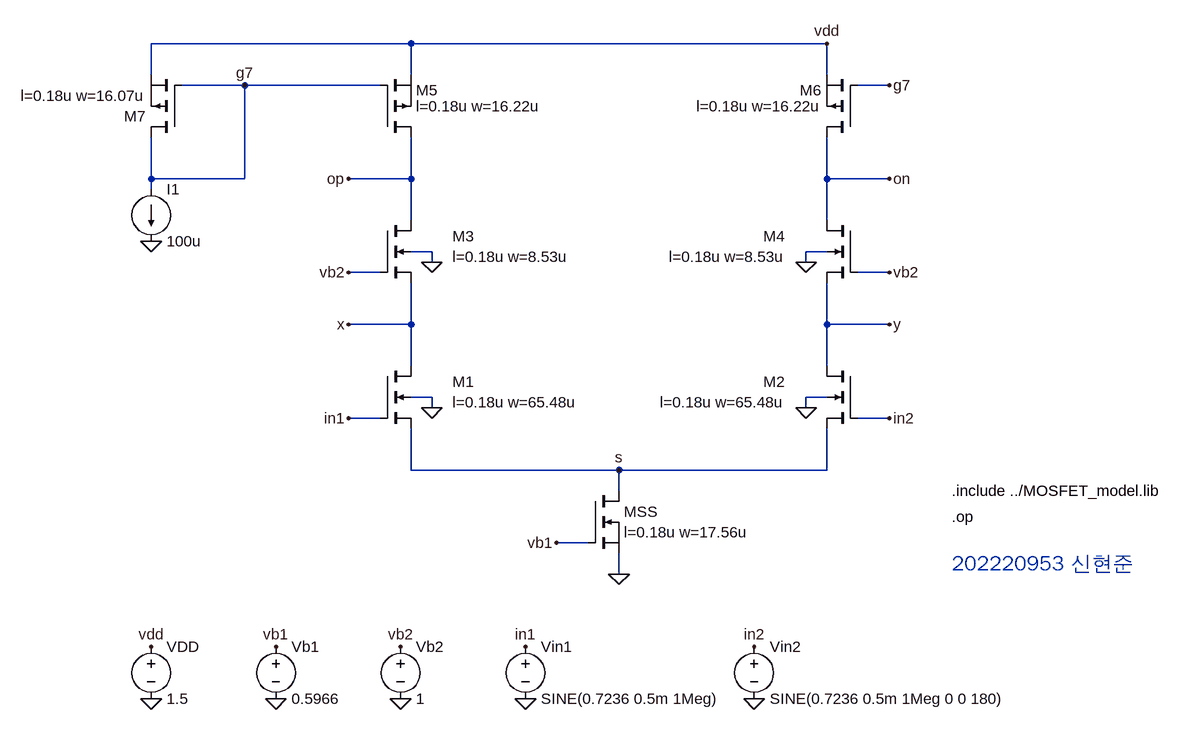
[diagram p0: schematic diffamp.asc]
diffamp.asc, the LTspice schematic file:
Version 4
SHEET 1 1800 1200
WIRE 160 96 560 96
WIRE 560 96 1200 96
FLAG 1200 96 vdd
WIRE 160 96 160 144
WIRE 560 96 560 144
WIRE 1200 96 1200 144
SYMBOL pmos 208 240 R180
WINDOW 3 0 0 Invisible 2
WINDOW 123 56 64 Left 2
SYMATTR InstName M7
SYMATTR Value CMOSP
SYMATTR Value2 l=0.18u w=16.07u
WIRE 160 240 160 304
WIRE 160 304 304 304
WIRE 304 304 304 160
WIRE 208 160 304 160
WIRE 304 160 512 160
FLAG 304 160 g7
DATAFLAG 408 208 "V(g7)"
DATAFLAG 40 272 "Id(M7)"
WIRE 160 304 160 320
SYMBOL current 160 320 R0
SYMATTR InstName I1
SYMATTR Value 100u
FLAG 160 400 0
SYMBOL pmos 512 240 M180
WINDOW 3 0 0 Invisible 2
WINDOW 0 56 72 Left 2
WINDOW 123 56 48 Left 2
SYMATTR InstName M5
SYMATTR Value CMOSP
SYMATTR Value2 l=0.18u w=16.22u
SYMBOL nmos4 512 368 R0
WINDOW 3 0 0 Invisible 2
WINDOW 0 112 24 Left 2
WINDOW 123 112 56 Left 2
SYMATTR InstName M3
SYMATTR Value CMOSN
SYMATTR Value2 l=0.18u w=8.53u
SYMBOL nmos4 512 592 R0
WINDOW 3 0 0 Invisible 2
WINDOW 0 112 24 Left 2
WINDOW 123 112 56 Left 2
SYMATTR InstName M1
SYMATTR Value CMOSN
SYMATTR Value2 l=0.18u w=65.48u
WIRE 560 240 560 304
WIRE 560 304 560 368
WIRE 560 304 464 304
FLAG 464 304 op
WIRE 560 464 560 528
WIRE 560 528 560 592
WIRE 560 528 464 528
FLAG 464 528 x
WIRE 512 448 464 448
FLAG 464 448 vb2
WIRE 512 672 464 672
FLAG 464 672 in1
WIRE 560 416 592 416
WIRE 592 416 592 432
FLAG 592 432 0
WIRE 560 640 592 640
WIRE 592 640 592 656
FLAG 592 656 0
DATAFLAG 680 304 "V(op)"
DATAFLAG 680 528 "V(x)"
DATAFLAG 680 256 "Id(M5)"
DATAFLAG 720 464 "Id(M3)"
DATAFLAG 720 688 "Id(M1)"
SYMBOL pmos 1248 240 R180
WINDOW 3 0 0 Invisible 2
WINDOW 0 56 72 Left 2
WINDOW 123 56 48 Left 2
SYMATTR InstName M6
SYMATTR Value CMOSP
SYMATTR Value2 l=0.18u w=16.22u
SYMBOL nmos4 1248 368 M0
WINDOW 3 0 0 Invisible 2
WINDOW 0 112 24 Left 2
WINDOW 123 112 56 Left 2
SYMATTR InstName M4
SYMATTR Value CMOSN
SYMATTR Value2 l=0.18u w=8.53u
SYMBOL nmos4 1248 592 M0
WINDOW 3 0 0 Invisible 2
WINDOW 0 112 24 Left 2
WINDOW 123 112 56 Left 2
SYMATTR InstName M2
SYMATTR Value CMOSN
SYMATTR Value2 l=0.18u w=65.48u
WIRE 1200 240 1200 304
WIRE 1200 304 1200 368
WIRE 1200 304 1296 304
FLAG 1296 304 on
WIRE 1200 464 1200 528
WIRE 1200 528 1200 592
WIRE 1200 528 1296 528
FLAG 1296 528 y
WIRE 1248 448 1296 448
FLAG 1296 448 vb2
WIRE 1248 672 1296 672
FLAG 1296 672 in2
WIRE 1248 160 1296 160
FLAG 1296 160 g7
WIRE 1200 416 1168 416
WIRE 1168 416 1168 432
FLAG 1168 432 0
WIRE 1200 640 1168 640
WIRE 1168 640 1168 656
FLAG 1168 656 0
DATAFLAG 1080 304 "V(on)"
DATAFLAG 1080 528 "V(y)"
DATAFLAG 1080 256 "Id(M6)"
DATAFLAG 1040 464 "Id(M4)"
DATAFLAG 1040 688 "Id(M2)"
WIRE 560 688 560 752
WIRE 1200 688 1200 752
WIRE 560 752 880 752
WIRE 880 752 1200 752
FLAG 880 752 s
DATAFLAG 720 784 "V(s)"
SYMBOL nmos 832 784 R0
WINDOW 3 0 0 Invisible 2
WINDOW 123 56 64 Left 2
SYMATTR InstName MSS
SYMATTR Value CMOSN
SYMATTR Value2 l=0.18u w=17.56u
WIRE 880 752 880 784
WIRE 880 880 880 912
FLAG 880 912 0
WIRE 832 864 784 864
FLAG 784 864 vb1
DATAFLAG 1008 912 "Id(MSS)"
SYMBOL voltage 160 1008 R0
WINDOW 0 24 16 Left 2
WINDOW 3 24 96 Left 2
SYMATTR InstName VDD
SYMATTR Value 1.5
FLAG 160 1024 vdd
FLAG 160 1104 0
SYMBOL voltage 352 1008 R0
WINDOW 0 24 16 Left 2
WINDOW 3 24 96 Left 2
SYMATTR InstName Vb1
SYMATTR Value 0.5966
FLAG 352 1024 vb1
FLAG 352 1104 0
SYMBOL voltage 544 1008 R0
WINDOW 0 24 16 Left 2
WINDOW 3 24 96 Left 2
SYMATTR InstName Vb2
SYMATTR Value 1
FLAG 544 1024 vb2
FLAG 544 1104 0
SYMBOL voltage 736 1008 R0
WINDOW 0 24 16 Left 2
WINDOW 3 24 96 Left 2
SYMATTR InstName Vin1
SYMATTR Value SINE(0.7236 0.5m 1Meg)
FLAG 736 1024 in1
FLAG 736 1104 0
SYMBOL voltage 1088 1008 R0
WINDOW 0 24 16 Left 2
WINDOW 3 24 96 Left 2
SYMATTR InstName Vin2
SYMATTR Value SINE(0.7236 0.5m 1Meg 0 0 180)
FLAG 1088 1024 in2
FLAG 1088 1104 0
TEXT 1392 784 Left 2 !.include ../MOSFET_model.lib
TEXT 1392 824 Left 2 !.op
TEXT 1392 896 Left 3 ;202220953 신현준

The netlist it stands for:
* diffamp.asc
M7 g7 g7 vdd vdd CMOSP l=0.18u w=16.07u
I1 g7 0 100u
M5 op g7 vdd vdd CMOSP l=0.18u w=16.22u
M3 op vb2 x 0 CMOSN l=0.18u w=8.53u
M1 x in1 s 0 CMOSN l=0.18u w=65.48u
M6 on g7 vdd vdd CMOSP l=0.18u w=16.22u
M4 on vb2 y 0 CMOSN l=0.18u w=8.53u
M2 y in2 s 0 CMOSN l=0.18u w=65.48u
MSS s vb1 0 0 CMOSN l=0.18u w=17.56u
VDD vdd 0 1.5
Vb1 vb1 0 0.5966
Vb2 vb2 0 1
Vin1 in1 0 SINE(0.7236 0.5m 1Meg)
Vin2 in2 0 SINE(0.7236 0.5m 1Meg 0 0 180)
.model NMOS NMOS
.model PMOS PMOS
.lib standard.mos
.include ../MOSFET_model.lib
.op
* 202220953 신현준
.backanno
.end